# Altium schematic sheet +3V3 1.5A Linear Voltage Regulator.SchDoc
size A
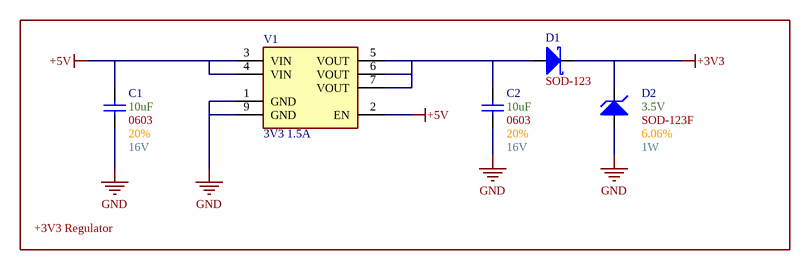
[diagram p0: +3V3 1.5A Linear Voltage Regulator.SchDoc]

## Parts
C1  Max Voltage: 16V  Size Package: 0603  Tolerance: 20%  Capacitance: 10uF  [[Cap] SMD 0603]  (hidden comment: [Cap] 0603 10uF 20% 16V)
C2  Max Voltage: 16V  Size Package: 0603  Tolerance: 20%  Capacitance: 10uF  [[Cap] SMD 0603]  (hidden comment: [Cap] 0603 10uF 20% 16V)
D1  Footprint: SOD-123  [[Diode] SMD SOD-123]  (hidden comment: SOD123)
D2  Tolerance: 6.06%  Wattage: 1W  Optimal Zener Voltage: 3.5V  [[Diode] SOD-123F]  (hidden comment: SOD-123F)
V1  3V3 1.5A  [[Linear] 3V3 1.5A]

## Blocks framed on the sheet
+3V3 Regulator: C1 C2 D1 D2 V1

## Nets
+3V3: D1.1(K) D2.1(K)
+5V: C1.2 V1.2(EN) V1.3(VIN) V1.4(VIN)
GND: C1.1 C2.1 D2.2(A) V1.1(GND) V1.9(GND)
NetC2_2: C2.2 D1.2(A) V1.5(VOUT) V1.6(VOUT) V1.7(VOUT)

## Library data of the parts
C1 C2 = [Cap] 0603 10uF 20% 16V: GRM188C81C106MA73D; Supplier 1: DigiKey; Supplier Part Number 1: 490-7198-1-ND
D1 = [Schottky] SMD 40V 1A: B5819W-TP; Supplier 1: DigiKey; Supplier Part Number 1: B5819W-TPMSCT-ND
D2 = [Zener] SMD 3.5V 1W 6%: KDZVTR3.3B; Supplier 1: DigiKey; Supplier Part Number 1: 846-KDZVTR3.3BCT-ND; Footprint: SOD-123F
V1 = [Linear] SMD 3V3 1.5A: AP7362A-33SP-13; Supplier 1: DigiKey; Supplier Part Number 1: AP7362A-33SP-13DICT-ND